# EAGLE design RAINMETER_IR_HOLDER (EAGLE 9.6.2)
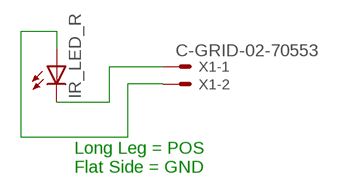
[diagram p0: schematic, sheet 1]

## Parts
IR_LED_R  LED5MM  [LED5MM]
X1  C-GRID-02-70553  [70553-02]

## Nets
N$1 [GND]: IR_LED_R.A X1.2
N$5 [GND]: IR_LED_R.K(C) X1.1

## Notes on the sheet
- Long Leg = POS
  Flat Side = GND

## Library data of the parts
IR_LED_R = adafruit:LED: LED OSRAM: - CHIPLED LG R971, LG N971, LY N971, LG Q971, LY Q971, LO R971, LY R971 LH N974, LH R974 LS Q976, LO Q976, LY Q976 LO Q996 - Hyper CHIPLED LW Q18S LB Q993, LB Q99A, LB R99A - SideLED LS A670, LO A670, LY A670, LG A670, LP A670 LB A673, LV A673, LT A673, LW A673 LH A674 LY A675 LS A676, LA A676, LO A676, LY A676, LW A676 LS A679, LY A679, LG A679 - Hyper Micro SIDELED® LS Y876, LA Y876, LO Y876, LY Y876 LT Y87S - SmartLED LW L88C, LW L88S LB L89C, LB L89S, LG L890 LS L89K, LO L89K, LY L89K LS L896, LA L896, LO L896, LY L896 - TOPLED LS T670, LO T670, LY T670, LG T670, LP T670 LSG T670, LSP T670, LSY T670, LOP T670, LYG T670 LG T671, LOG T671, LSG T671 LB T673, LV T673, LT T673, LW T673 LH T674 LS T676, LA T676, LO T676, LY T676, LB T676, LH T676, LSB T676, LW T676 LB T67C, LV T67C, LT T67C, LS T67K, LO T67K, LY T67K, LW E67C LS E67B, LA E67B, LO E67B, LY E67B, LB E67C, LV E67C, LT E67C LW T67C LS T679, LY T679, LG T679 LS T770, LO T770, LY T770, LG T770, LP T770 LB T773, LV T773, LT T773, LW T773 LH T774 LS E675, LA E675, LY E675, LS T675 LS T776, LA T776, LO T776, LY T776, LB T776 LHGB T686 LT T68C, LB T68C - Hyper Mini TOPLED® LB M676 - Mini TOPLED Santana® LG M470 LS M47K, LO M47K, LY M47K Source: http://www.osram.convergy.de/
X1 = con-molex:C-GRID-02: CONNECTOR wire to board 2.54 mm (0.100") pitch header; OC_FARNELL: unknown; OC_NEWARK: unknown

## Net classes
0 default: width 0.8 mm, drill 0.508 mm, clearance 0.6 mm
1 POWER: width 0.8 mm, drill 0.508 mm, clearance 0.6 mm
2 12V: width 0.8 mm, drill 0.508 mm, clearance 0.6 mm
3 5V: width 0.8 mm, drill 0.508 mm, clearance 0.6 mm
4 3V: width 0.8 mm, drill 0.508 mm, clearance 0.6 mm
5 GND: width 0.8 mm, drill 0.508 mm, clearance 0.6 mm

## Board
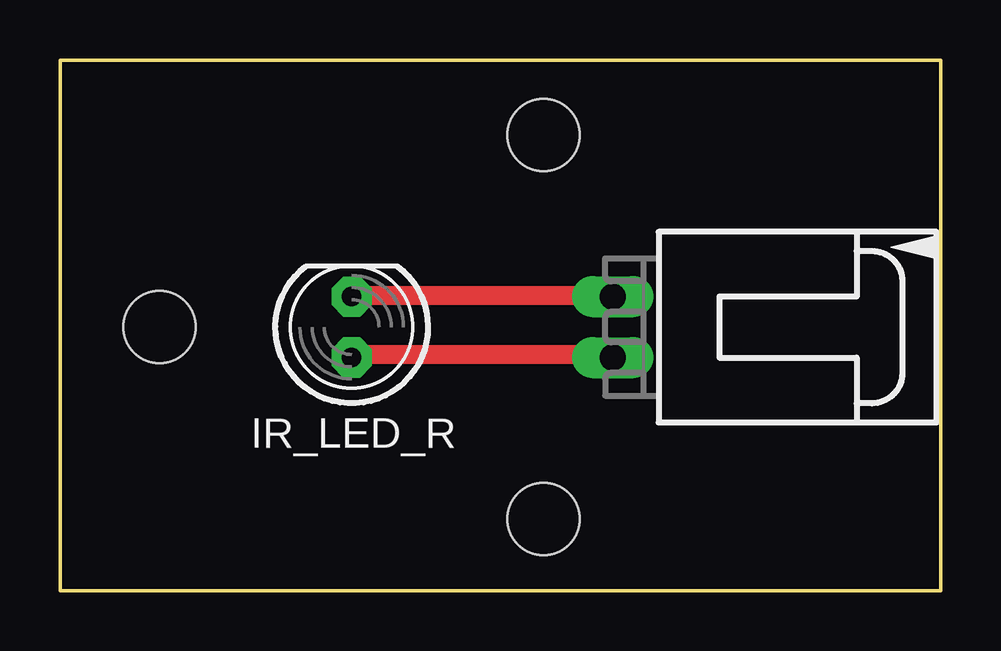
[diagram p1: board, top side]

Size 36.7 x 22.12 mm. Coordinates in mm from the lower left corner, seen from the top.
Outline: 0,22.12 36.7,22.12 36.7,0 0,0 0,22.12
Copper layers (1*16): Top 0.035mm / dielectric 1.5mm / Bottom 0.035mm
Design rules "default_BDV_04 *": minimum track width 6mil, minimum drill 0.35mm, track to track 6mil, track to pad 6mil, pad to pad 6mil, via to via 6mil, smd to smd 6mil, copper to edge 40mil, drill to drill 6mil, minimum pad ring 12mil, minimum via ring 8mil, stop-mask expansion 4mil, vias tented up to drill 20mil, thermal gap 16mil
Holes 3 mm at 4.15,10.99 20.15,18.99 20.15,2.99

### Footprints (pad centres in the part's own frame; a part is rotated, then mirrored left to right if it is on the bottom)
LED5MM = drill 0.813 pad 1.676 octagon: A -1.27,0; K 1.27,0
70553-02 = drill 1.092 long: 1 -1.27,-7.62; 2 1.27,-7.62

### Placement (x,y rotation side)
IR_LED_R  12.15,10.99 90 top
X1  30.65,10.99 270 top

### Tracks (layer width: path | path; a pad name or v marks a point on that pad's centre or on a via)
N$1
  Top 0.8: IR_LED_R.A 12.25,9.85 22.75,9.85 X1.2
N$5
  Top 0.8: IR_LED_R.K 12.25,12.3 22.75,12.3 X1.1

### Text on the board
tValues: - | +